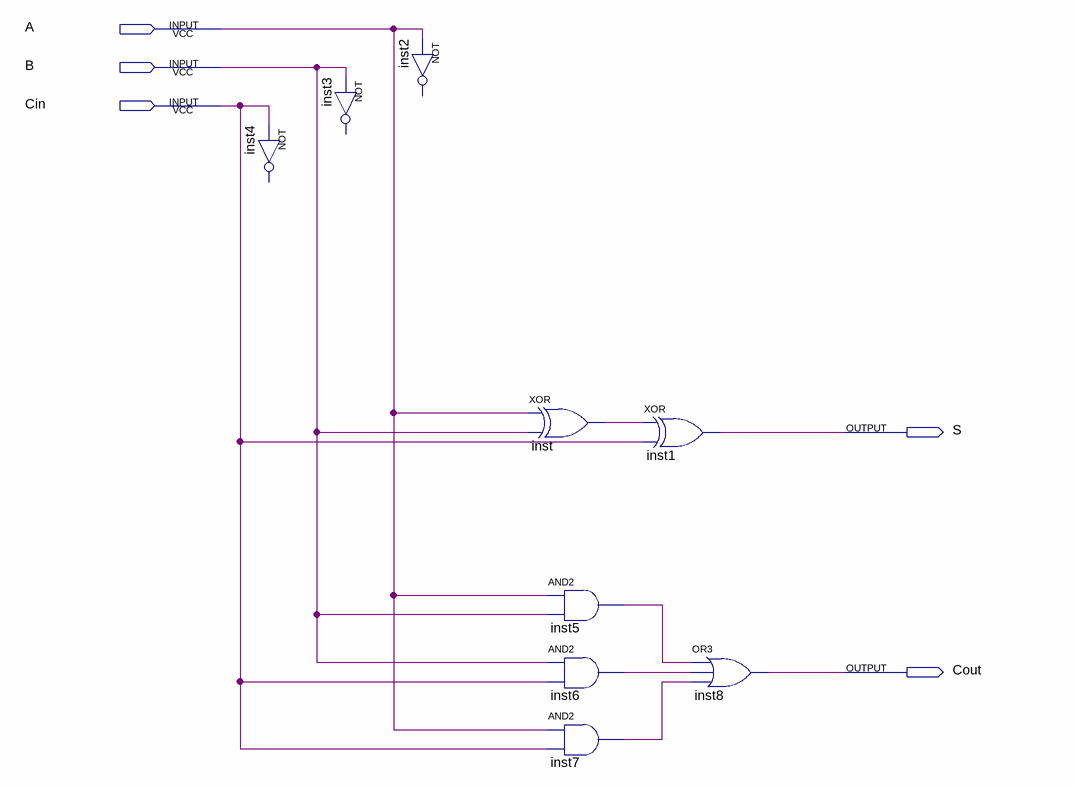
[diagram p0: schematic sheet]
// Quartus schematic full_adder.bdf as structural Verilog: 9 symbols, 5 pins
module full_adder (
  input  A,
  input  B,
  input  Cin,
  output S,
  output Cout
);

  wire inst5_out, inst6_out, inst7_out, inst_out;

  // NOT inst4 has open pins: IN=Cin, OUT=open
  // NOT inst3 has open pins: IN=B, OUT=open
  // NOT inst2 has open pins: IN=A, OUT=open
  xor inst (inst_out, A, B);
  and inst5 (inst5_out, A, B);
  and inst6 (inst6_out, B, Cin);
  and inst7 (inst7_out, A, Cin);
  xor inst1 (S, inst_out, Cin);
  or inst8 (Cout, inst5_out, inst6_out, inst7_out);
endmodule
